# Altium schematic sheet Power_Controller-Sheet.SchDoc (part 1 of 3)
size 420 x 297 mm; SheetNumber: 3; SheetTotal: 4
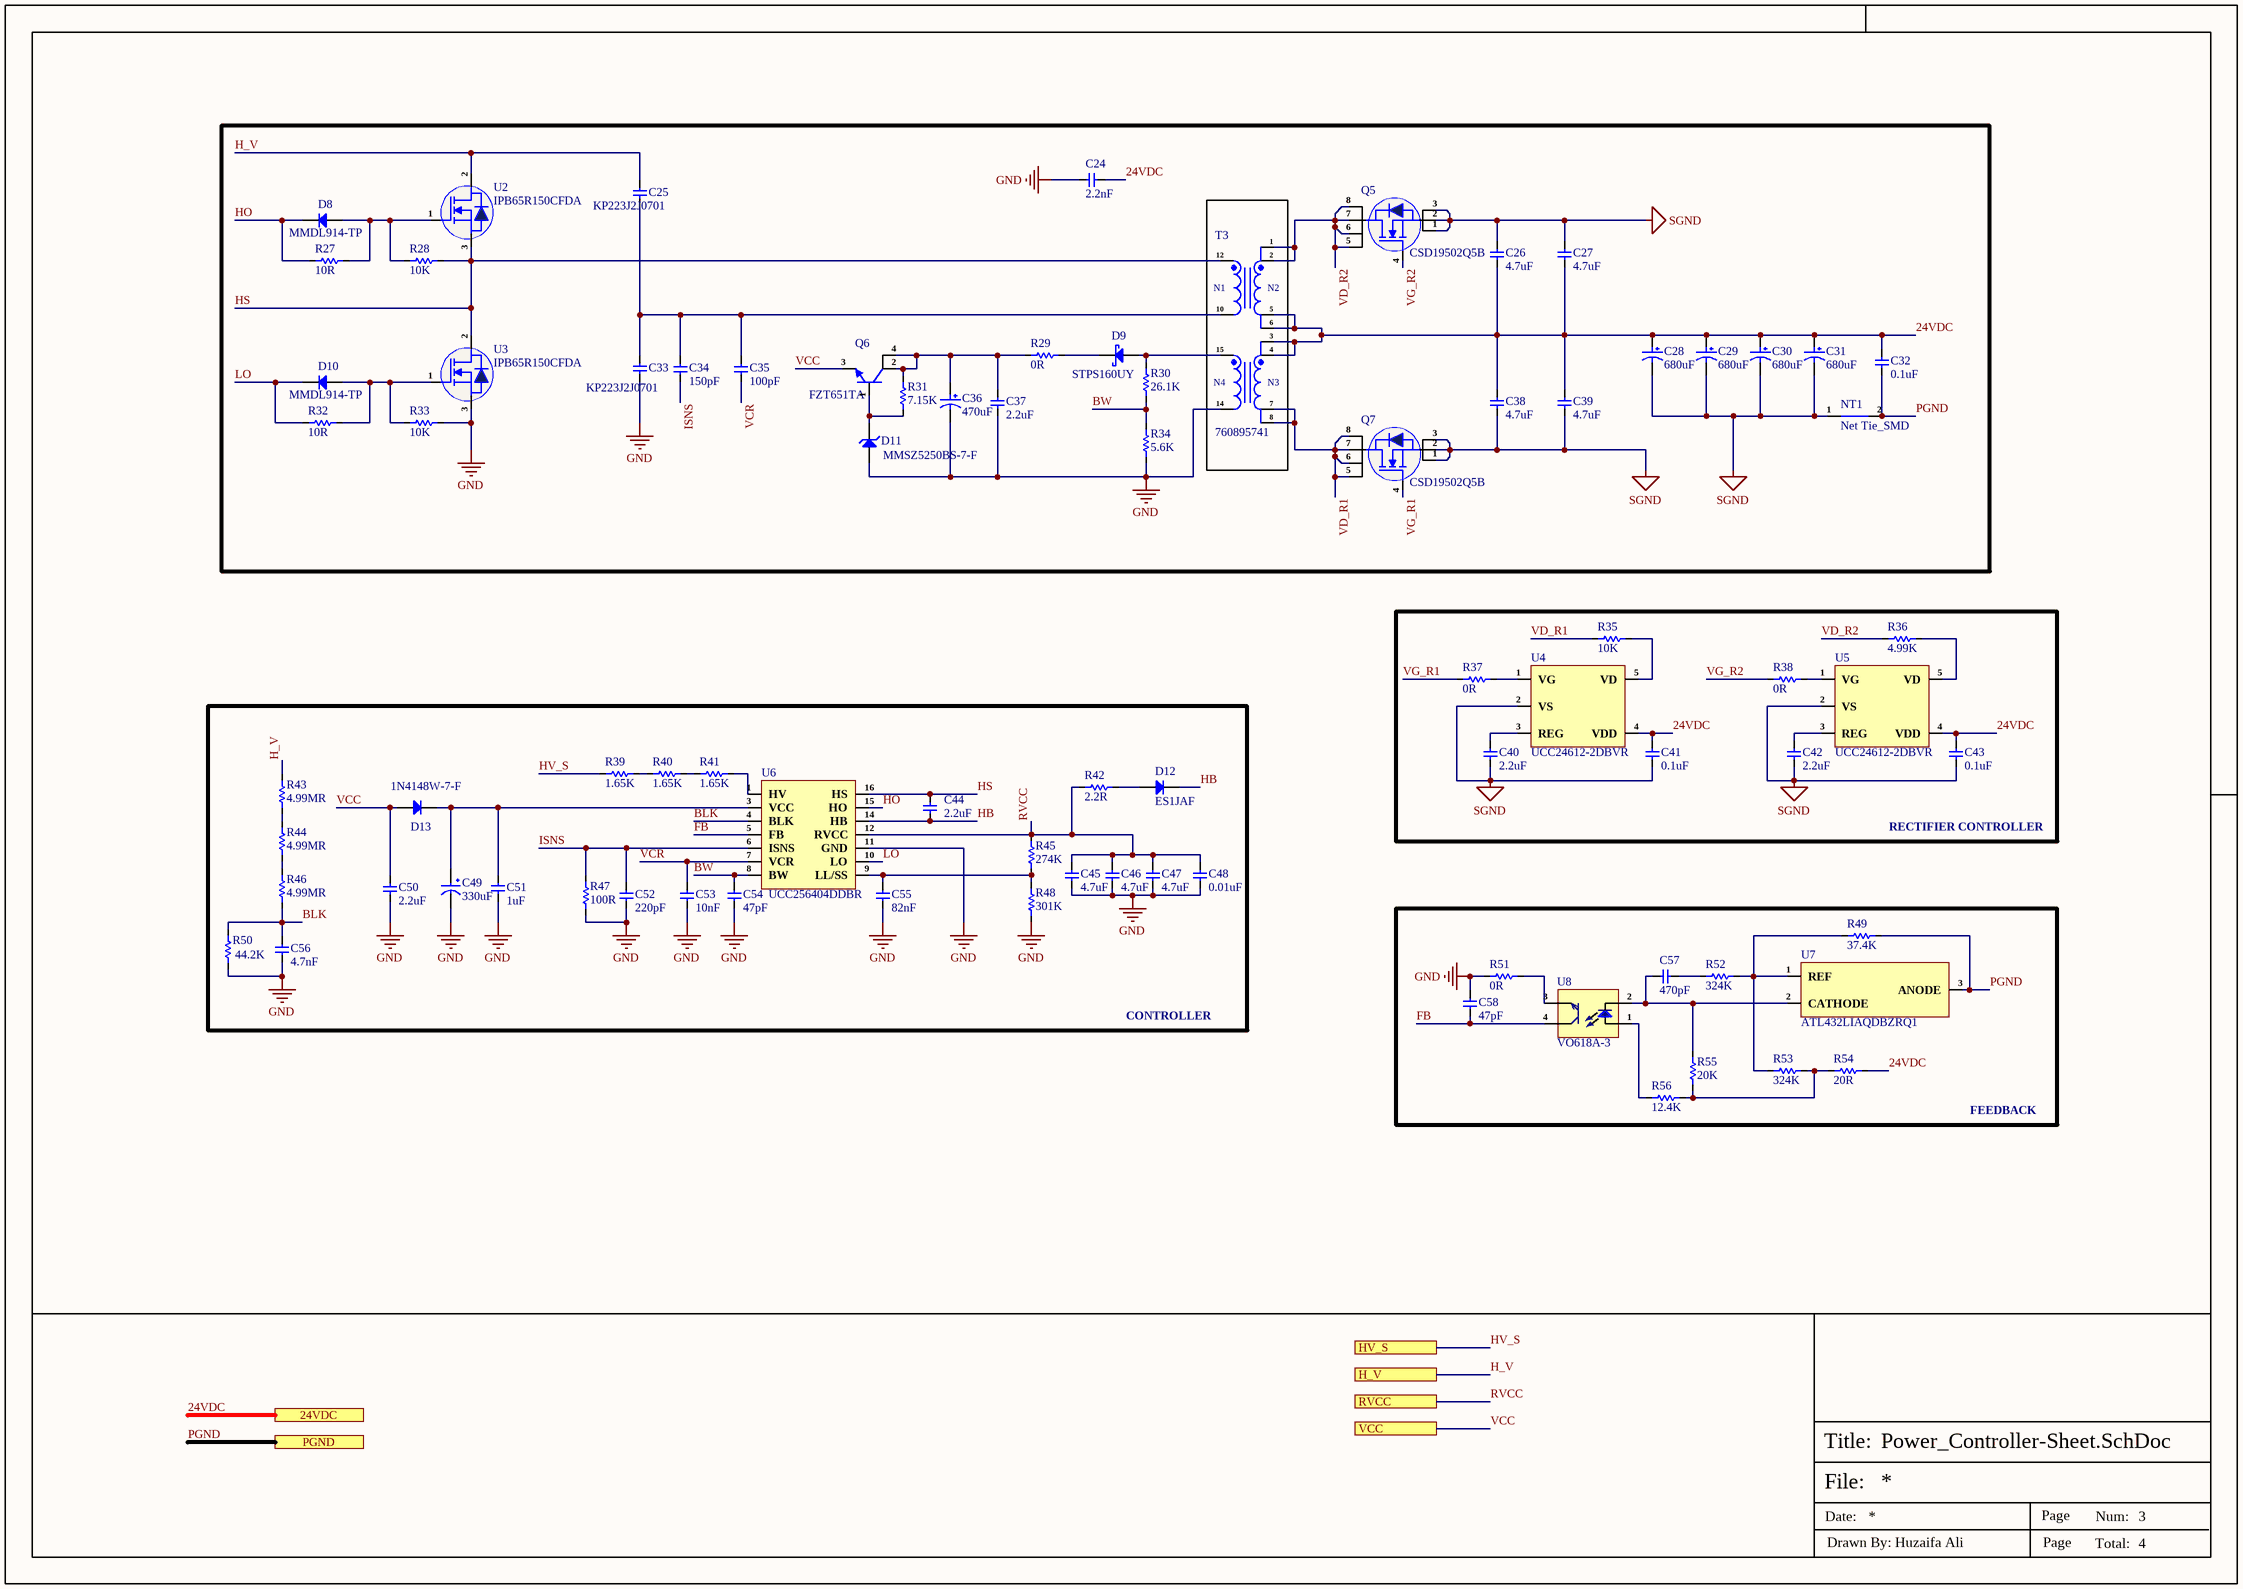
[diagram p0: Power_Controller-Sheet.SchDoc]

## Parts
C24  2.2nF  [DE1E3RA222MA4BN01F]
C25  KP223J2J0701  [KP223J2J0701]
C26  4.7uF  [Cap-1206]
C27  4.7uF  [Cap-1206]
C28  680uF  [EEU-FR1V681B]
C29  680uF  [EEU-FR1V681B]
C30  680uF  [EEU-FR1V681B]
C31  680uF  [EEU-FR1V681B]
C32  0.1uF  [Cap-1206]
C33  KP223J2J0701  [KP223J2J0701]
C34  150pF  [Cap-1206]
C35  100pF  [Cap-1206]
C36  470uF  [EEUFR1V471B]
C37  2.2uF  [Cap-1206]
C38  4.7uF  [Cap-1206]
C39  4.7uF  [Cap-1206]
C40  2.2uF  [CAP-0603]
C41  0.1uF  [Cap-1206]
C42  2.2uF  [CAP-0603]
C43  0.1uF  [Cap-1206]
C44  2.2uF  [Cap-1206]
C45  4.7uF  [Cap-0603]
C46  4.7uF  [Cap-0603]
C47  4.7uF  [Cap-0603]
C48  0.01uF  [Cap-0603]
C49  330uF  [RC035M331LO8*14TH-2A1E]
C50  2.2uF  [Cap-0603]
C51  1uF  [Cap-1206]
C52  220pF  [Cap-0603]
C53  10nF  [Cap-0603]
C54  47pF  [Cap-0402]
C55  82nF  [Cap-0603]
C56  4.7nF  [Cap-0603]
C57  470pF  [Cap-0603]
C58  47pF  [Cap-0603]
D8  MMDL914-TP  [SOD-323]
D9  STPS160UY  [SMB_]
D10  MMDL914-TP  [SOD-323]
D11  MMSZ5250BS-7-F  [SOD-323]
D12  ES1JAF  [DO-214AD (SMAF)]
D13  1N4148W-7-F  [SOD-123]
NT1  Net Tie_SMD  [Net Tie Pad]  (net tie, no BOM)
Q5  CSD19502Q5B  [VSON-CLIP-8(6x5)]
Q6  FZT651TA  [SOT- 223]
Q7  CSD19502Q5B  [VSON-CLIP-8(6x5)]
R27  10R  [Res-0603]
R28  10K  [RES-0805]
R29  0R  [Res-1206]
R30  26.1K  [Res-0603]
R31  7.15K  [Res-0603]
R32  10R  [Res-0603]
R33  10K  [RES-0805]
R34  5.6K  [RES-0805]
R35  10K  [Res-0603]
R36  4.99K  [Res-0603]
R37  0R  [Res-0402]
R38  0R  [Res-0402]
R39  1.65K  [Res-1206]
R40  1.65K  [Res-1206]
R41  1.65K  [Res-1206]
R42  2.2R  [Res-0603]
R43  4.99MR  [Res-1206]
R44  4.99MR  [Res-1206]
R45  274K  [Res-0603]
R46  4.99MR  [Res-1206]
R47  100R  [Res-0603]
R48  301K  [res-0603]
R49  37.4K  [Res-0603]
R50  44.2K  [Res-0603]
R51  0R  [Res-0603]
R52  324K  [Res-0603]
R53  324K  [Res-0603]
R54  20R  [Res-0603]
R55  20K  [Res-1206]
R56  12.4K  [Res-0603]
T3  760895741  [760895741]
U2  IPB65R150CFDA  [TO-263]
U3  IPB65R150CFDA  [TO-263]
U4  UCC24612-2DBVR  [SOT-23-5]
U5  UCC24612-2DBVR  [SOT-23-5]
U6  UCC256404DDBR  [UCC256404DDBR]
U7  ATL432LIAQDBZRQ1  [SOT-23]
U8  VO618A-3  [DIP-4]

## Blocks framed on the sheet
RECTIFIER CONTROLLER: C40-C43 R35-R38 U4 U5
CONTROLLER: C44-C56 D12 D13 R39-R48 R50 U6
FEEDBACK: C57 C58 R49 R51-R56 U7 U8

## Ports
24VDC (see Top-Sheet[3B], Connector-Sheet[1D]), H_V (see Top-Sheet[2B], PFC-Sheet[1D]), HV_S (see Top-Sheet[2B], PFC-Sheet[1D]), PGND (see Top-Sheet[3B], Connector-Sheet[1D]), RVCC (see Top-Sheet[2B], PFC-Sheet[1D]), VCC (see Top-Sheet[2B], PFC-Sheet[1D])

## Nets
GND: C24.1 C33.2 C36.2 C37.1 C45.1 C46.1 C47.1 C48.1 C49.2 C50.1 C51.2 C52.1 C53.1 C54.1 C55.1 C56.1 C58.2 D11.2(A) R33.2 R34.1 R47.1 R48.1 R50.1 R51.1 T3.14 U3.3(S) U6.11(GND)
SGND: C26.2 C27.2 C28.2 C29.2 C30.2 C31.2 C38.1 C39.1 C40.1 C41.1 C42.1 C43.1 NT1.1 Q5.1(S) Q5.2(S) Q5.3(S) Q7.1(S) Q7.2(S) Q7.3(S) U4.2(VS) U5.2(VS)
24VDC: C24.2 C26.1 C27.1 C28.1 C29.1 C30.1 C31.1 C32.2 C38.2 C39.2 C41.2 C43.2 R54.2 T3.3 T3.4 T3.5 T3.6 U4.4(VDD) U5.4(VDD) ; port 24VDC
BLK: C56.2 R46.1 R50.2 U6.4(BLK)
BW: C54.2 R30.1 R34.2 U6.8(BW)
FB: C58.1 U6.5(FB) U8.4(C)
H_V: C25.1 R43.2 U2.2(D) ; port H_V
HB: C44.1 D12.1(K) U6.14(HB)
HO: D8.1(K) R27.1 U6.15(HO)
HS: C44.2 R28.2 T3.12 U2.3(S) U3.2(D) U6.16(HS)
HV_S: R39.1 ; port HV_S
ISNS: C34.1 C52.2 R47.2 U6.6(ISNS)
LO: D10.1(K) R32.1 U6.10(LO)
PGND: C32.1 NT1.2 R49.2 U7.3(ANODE) ; port PGND
RVCC: C45.2 C46.2 C47.2 C48.2 R42.1 R45.2 U6.12(RVCC) ; port RVCC
VCC: C50.2 D13.1(A) Q6.3(E) ; port VCC
VCR: C35.1 C53.2 U6.7(VCR)
VD_R1: Q7.5(D) Q7.6(D) Q7.7(D) Q7.8(D) R35.1 T3.7 T3.8
VD_R2: Q5.5(D) Q5.6(D) Q5.7(D) Q5.8(D) R36.1 T3.1 T3.2
VG_R1: Q7.4(G) R37.1
VG_R2: Q5.4(G) R38.1
NetC25_2: C25.2 C33.1 C34.2 C35.2 T3.10
NetC36_1: C36.1 C37.2 Q6.2(C) Q6.4(C) R29.1 R31.2
NetC40_2: C40.2 U4.3(REG)
NetC42_2: C42.2 U5.3(REG)
NetC49_1: C49.1 C51.1 D13.2(K) U6.3(VCC)
NetC55_2: C55.2 R45.1 R48.2 U6.9(LL/SS)
NetC57_1: C57.1 R55.2 U7.2(CATHODE) U8.2(Ca)
NetC57_2: C57.2 R52.1
NetD8_2: D8.2(A) R27.2 R28.1 U2.1(G)
NetD9_1: D9.1(A) R30.2 T3.15
NetD9_2: D9.2(K) R29.2
NetD10_2: D10.2(A) R32.2 R33.1 U3.1(G)
NetD11_1: D11.1(K) Q6.1(B) R31.1
NetD12_2: D12.2(A) R42.2
NetR35_2: R35.2 U4.5(VD)
NetR36_2: R36.2 U5.5(VD)
NetR37_2: R37.2 U4.1(VG)
NetR38_2: R38.2 U5.1(VG)
NetR39_2: R39.2 R40.1
NetR40_2: R40.2 R41.1
NetR41_2: R41.2 U6.1(HV)
NetR43_1: R43.1 R44.2
NetR44_1: R44.1 R46.2
NetR49_1: R49.1 R52.2 R53.1 U7.1(REF)
NetR51_2: R51.2 U8.3(E)
NetR53_2: R53.2 R54.1 R55.1 R56.2
NetR56_1: R56.1 U8.1(An)

## Notes on the sheet
- File:
- Title:
- Date:
- Page
- Num:
- Total:
- Drawn By: Huzaifa Ali
- (in symbol 760895741) N1; N2; N4; N3